# Altium schematic sheet 02.Power_Uint.SchDoc: 02.Power_Uint
size A4; Organization: Altium Limited; Address1: L3, 12a Rodborough Rd; Address2: Frenchs Forest; Address3: NSW; Address4: Australia 2086; Revision: V2.0; SheetNumber: 2; SheetTotal: 5; Project: TC264
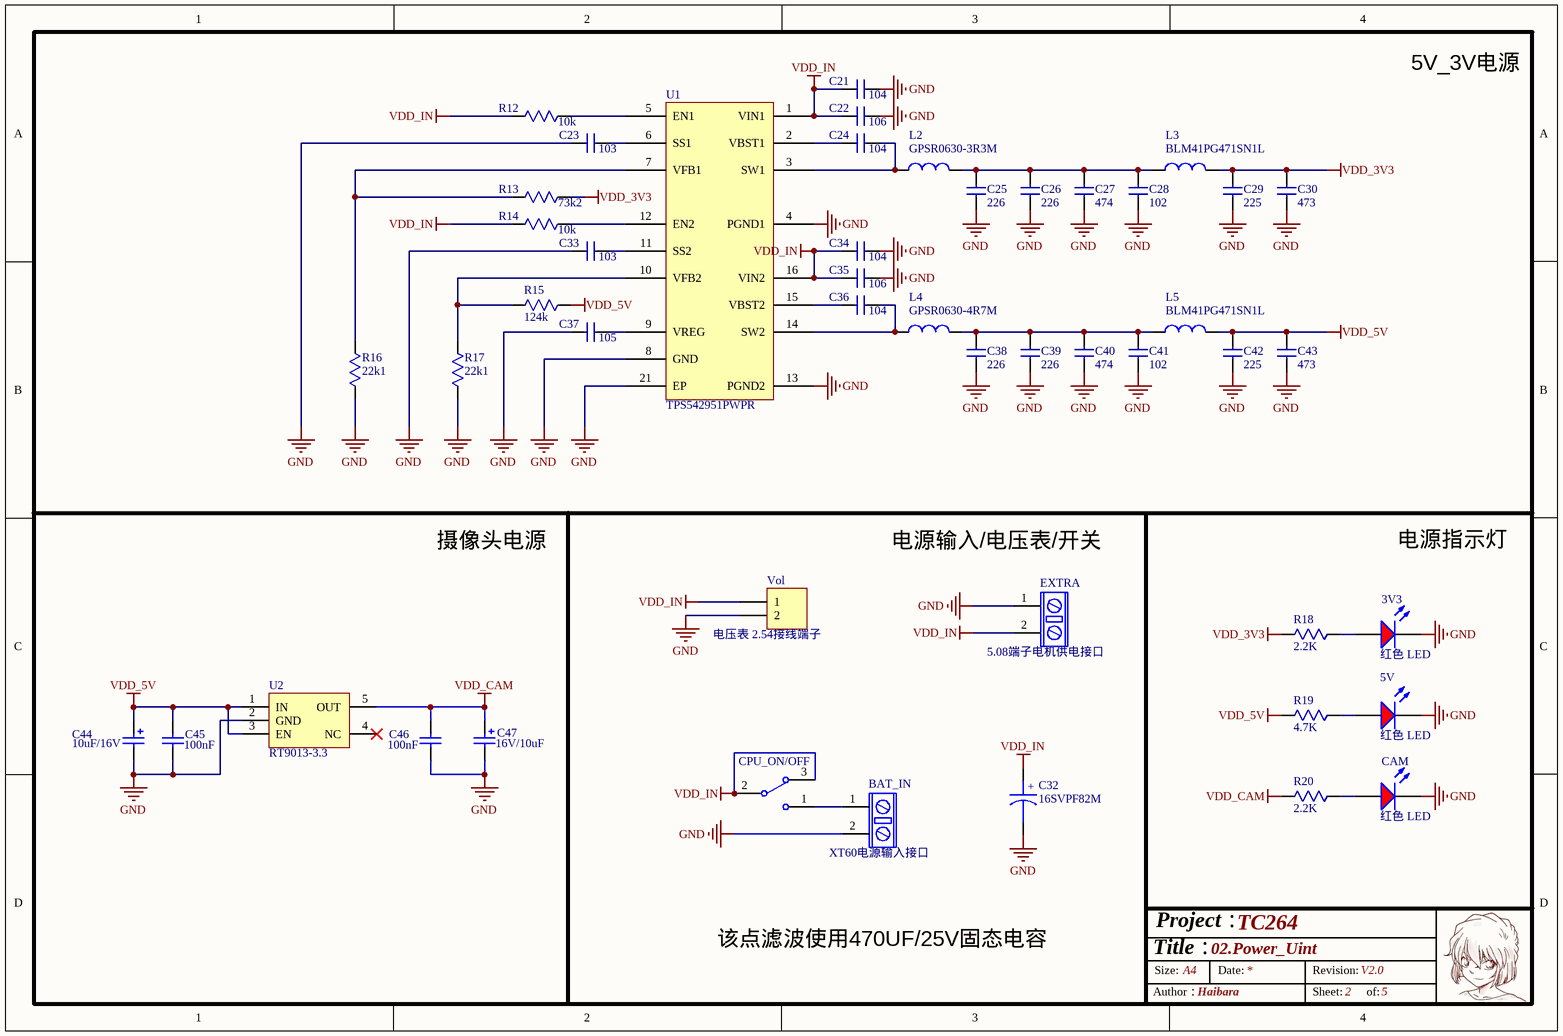
[diagram p0: 02.Power_Uint.SchDoc]

## Parts
3V3  红色 LED  [0603 LED R]
5V  红色 LED  [0603 LED R]
BAT_IN  XT60电源输入接口  [TX60PW-M20]
C21  104  [C0603]
C22  106  [C0805]
C23  103  [C0603]
C24  104  [C0805]
C25  226  [C0805]
C26  226  [C0805]
C27  474  [C0603]
C28  102  [C0603]
C29  225  [C0603]
C30  473  [C0603]
C32  16SVPF82M  [CAP 2.5*6.3*11.2]
C33  103  [C0603]
C34  104  [C0603]
C35  106  [C0805]
C36  104  [C0805]
C37  105  [C0603]
C38  226  [C0805]
C39  226  [C0805]
C40  474  [C0603]
C41  102  [C0603]
C42  225  [C0603]
C43  473  [C0603]
C44  10UF  [C0805]  (value not drawn)
C45  100nF  [0603 电容 C3]
C46  100nF  [0603 电容 C3]
C47  value 16V/10uF  [C0805]  (hidden comment: 10UF)
CAM  红色 LED  [0603 LED R]
CPU_ON/OFF  SW-SPDT  [MTS-102S 两档纽子开关]  (value not drawn)
EXTRA  5.08端子电机供电接口  [5.08 2P 螺钉端子]
L2  GPSR0630-3R3M  [L 0630]
L3  BLM41PG471SN1L  [R1206]
L4  GPSR0630-4R7M  [L 0630]
L5  BLM41PG471SN1L  [R1206]
R12  10k  [R0603]
R13  73k2  [R0603]
R14  10k  [R0603]
R15  124k  [R0603]
R16  22k1  [R0603]
R17  22k1  [R0603]
R18  2.2K  [R0603]
R19  4.7K  [R0603]
R20  2.2K  [R0603]
U1  TPS542951PWPR  [SSOP16_EP]
U2  RT9013-3.3  [SOT23-5N]
Vol  电压表 2.54接线端子  [XH2.54-LI-2P]

## Nets
GND: 3V3.2 5V.2 BAT_IN.2 C21.2 C22.2 C23.1 C25.1 C26.1 C27.1 C28.1 C29.1 C30.1 C32.2 C33.1 C34.2 C35.2 C37.1 C38.1 C39.1 C40.1 C41.1 C42.1 C43.1 C44.2 C45.1 C46.1 C47.2 CAM.2 EXTRA.1 R16.1 R17.1 U1.4(PGND1) U1.8(GND) U1.13(PGND2) U1.21(EP) U2.2(GND) Vol.2
VDD_3V3: C29.2 C30.2 L3.2 R13.1 R18.1
VDD_5V: C42.2 C43.2 C44.1 C45.2 L5.2 R15.1 R19.1 U2.1(IN) U2.3(EN)
VDD_CAM: C46.2 C47.1 R20.1 U2.5(OUT)
VDD_IN: C21.1 C22.1 C32.1 C34.1 C35.1 CPU_ON/OFF.2 CPU_ON/OFF.3 EXTRA.2 R12.2 R14.2 U1.1(VIN1) U1.16(VIN2) Vol.1
Net3V3_1: 3V3.1 R18.2
Net5V_1: 5V.1 R19.2
NetBAT_IN_1: BAT_IN.1 CPU_ON/OFF.1
NetC23_2: C23.2 U1.6(SS1)
NetC24_1: C24.1 U1.2(VBST1)
NetC24_2: C24.2 L2.1 U1.3(SW1)
NetC25_2: C25.2 C26.2 C27.2 C28.2 L2.2 L3.1
NetC33_2: C33.2 U1.11(SS2)
NetC36_1: C36.1 U1.15(VBST2)
NetC36_2: C36.2 L4.1 U1.14(SW2)
NetC37_2: C37.2 U1.9(VREG)
NetC38_2: C38.2 C39.2 C40.2 C41.2 L4.2 L5.1
NetCAM_1: CAM.1 R20.2
NetR12_1: R12.1 U1.5(EN1)
NetR13_2: R13.2 R16.2 U1.7(VFB1)
NetR14_1: R14.1 U1.12(EN2)
NetR15_2: R15.2 R17.2 U1.10(VFB2)

Not connected (* = marked no-connect by the designer): U2 4(NC)*

## Notes on the sheet
- 该点滤波使用470UF/25V固态电容
- Labels drawn without touching a wire or pin: 5V_3V电源, 摄像头电源, 电源指示灯, 电源输入/电压表/开关
- Title：
- Size:
- Project：
- A4
- Date:
- Revision:
- Author：
- Haibara
- Sheet:
- of:
- (in symbol CAP POL) +
- (in symbol Cap Pol2) 10uF/16V

## Library data of the parts
3V3 5V CAM = 红灯: 发光二极管; ComponentLink1Description: 供应商链接; ComponentLink1URL: http://www.szlcsc.com/product/details_2668.html; Package: 0805; Supplier: LC; SuppliersPartNumber: C2295
BAT_IN EXTRA = 电机供电接口
C21-C30 C33-C43 = 电容
C32 = CAP POL: Capacitor
C44 C47 = Cap Pol2: Polarized Capacitor (Axial); Published: 8-Jun-2000; LatestRevisionDate: 17-Jul-2002; LatestRevisionNote: Re-released for DXP Platform.; PackageReference: POLAR0.8; Publisher: Altium Limited; PackageDescription: Polarized Capacitor; 2 Leads
C45 C46 = Cap: Capacitor; Published: 8-Jun-2000; LatestRevisionDate: 17-Jul-2002; LatestRevisionNote: Re-released for DXP Platform.; PackageReference: RAD-0.3; Publisher: Altium Limited; PackageDescription: Radial Cap, Thru-Hole; 2 Leads; 0.3 in Pin Spacing
CPU_ON/OFF = SW-SPDT: SPDT Subminiature Toggle Switch, Right Angle Mounting, Vertical Actuation; Published: 24-Mar-1999; LatestRevisionDate: 17-Dec-2003; LatestRevisionNote: Schematic revised, PCB Footprint replaced.; DatasheetVersion: 05-Dec-2000; PackageReference: TL36WW15050; Publisher: Altium Limited; PackageDescription: Switch; 4 Leads; ComponentLink1Description: Manufacturer Link; ComponentLink1URL: http://www.apem.com
L2 L4 = 电感
L3 L5 = 磁珠: BLM18PG471SN1D
R12-R20 = 电阻
U2 = RT9013-3.3: 3.3V电源芯片
Vol = Header 2: Header, 2-Pin; LatestRevisionDate: 17-Jul-2002; LatestRevisionNote: Re-released for DXP Platform.; Publisher: Altium Limited